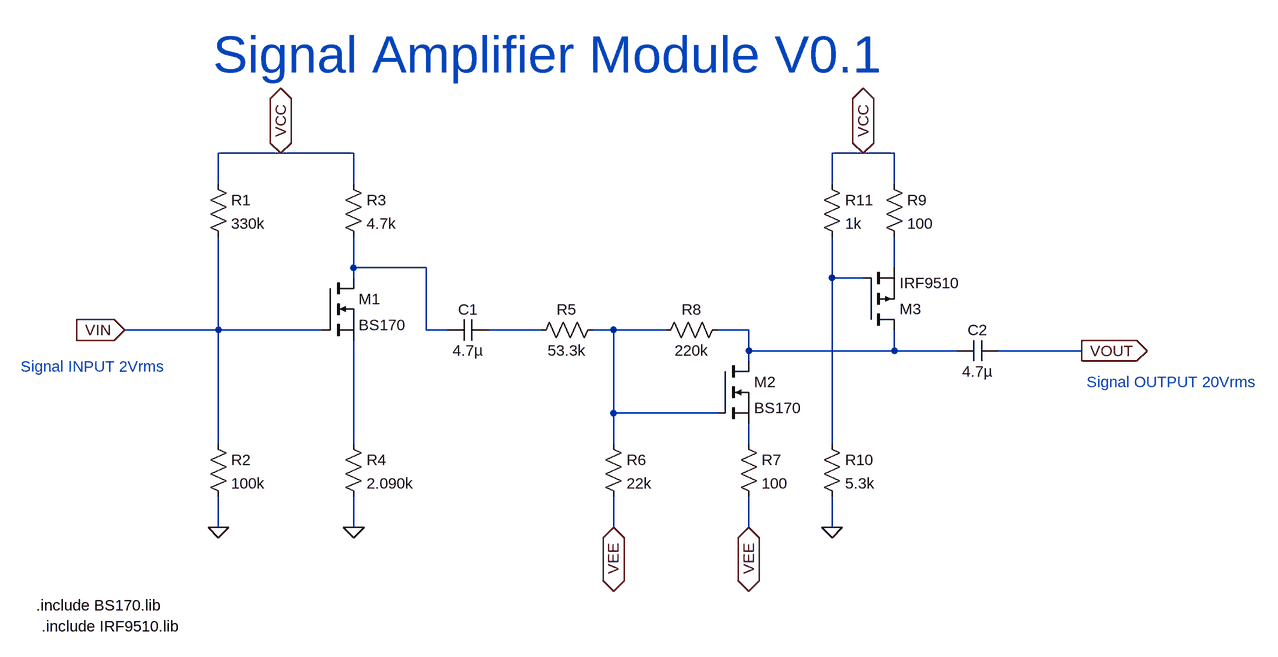
[diagram p0: schematic SigAmpModule_LTspice.asc]
SigAmpModule_LTspice.asc, the LTspice schematic file:
Version 4.1
SHEET 1 1688 680
WIRE 176 -80 80 -80
WIRE 288 -80 176 -80
WIRE 1072 -80 1024 -80
WIRE 1120 -80 1072 -80
WIRE 80 -32 80 -80
WIRE 288 -32 288 -80
WIRE 1024 -32 1024 -80
WIRE 1120 -32 1120 -80
WIRE 288 96 288 48
WIRE 400 96 288 96
WIRE 1120 96 1120 48
WIRE 288 112 288 96
WIRE 1024 112 1024 48
WIRE 1072 112 1024 112
WIRE 80 192 80 48
WIRE 80 192 -64 192
WIRE 240 192 80 192
WIRE 400 192 400 96
WIRE 432 192 400 192
WIRE 576 192 496 192
WIRE 688 192 656 192
WIRE 768 192 688 192
WIRE 896 192 848 192
WIRE 896 224 896 192
WIRE 1120 224 1120 192
WIRE 1120 224 896 224
WIRE 1216 224 1120 224
WIRE 1408 224 1280 224
WIRE 896 240 896 224
WIRE 688 320 688 192
WIRE 848 320 688 320
WIRE 80 368 80 192
WIRE 288 368 288 208
WIRE 688 368 688 320
WIRE 896 368 896 336
WIRE 1024 368 1024 112
WIRE 80 496 80 448
WIRE 288 496 288 448
WIRE 688 496 688 448
WIRE 896 496 896 448
WIRE 1024 496 1024 448
FLAG 176 -80 VCC
IOPIN 176 -80 BiDir
FLAG 80 496 0
FLAG -64 192 VIN
IOPIN -64 192 In
FLAG 288 496 0
FLAG 688 496 VEE
IOPIN 688 496 BiDir
FLAG 896 496 VEE
IOPIN 896 496 BiDir
FLAG 1024 496 0
FLAG 1072 -80 VCC
IOPIN 1072 -80 BiDir
FLAG 1408 224 VOUT
IOPIN 1408 224 Out
SYMBOL res 64 -48 R0
SYMATTR InstName R1
SYMATTR Value 330k
SYMBOL res 64 352 R0
SYMATTR InstName R2
SYMATTR Value 100k
SYMBOL res 272 -48 R0
SYMATTR InstName R3
SYMATTR Value 4.7k
SYMBOL res 272 352 R0
SYMATTR InstName R4
SYMATTR Value 2.090k
SYMBOL nmos 240 112 R0
SYMATTR InstName M1
SYMATTR Value BS170
SYMATTR Prefix X
SYMBOL cap 496 176 R90
WINDOW 0 0 32 VBottom 2
WINDOW 3 32 32 VTop 2
SYMATTR InstName C1
SYMATTR Value 4.7µ
SYMBOL res 672 176 R90
WINDOW 0 0 56 VBottom 2
WINDOW 3 32 56 VTop 2
SYMATTR InstName R5
SYMATTR Value 53.3k
SYMBOL res 880 352 R0
SYMATTR InstName R7
SYMATTR Value 100
SYMBOL res 672 352 R0
SYMATTR InstName R6
SYMATTR Value 22k
SYMBOL res 752 208 R270
WINDOW 0 32 56 VTop 2
WINDOW 3 0 56 VBottom 2
SYMATTR InstName R8
SYMATTR Value 220k
SYMBOL nmos 848 240 R0
SYMATTR InstName M2
SYMATTR Value BS170
SYMATTR Prefix X
SYMBOL pmos 1072 192 M180
SYMATTR InstName M3
SYMATTR Value IRF9510
SYMATTR Prefix X
SYMBOL res 1104 -48 R0
SYMATTR InstName R9
SYMATTR Value 100
SYMBOL res 1008 352 R0
SYMATTR InstName R10
SYMATTR Value 5.3k
SYMBOL res 1008 -48 R0
SYMATTR InstName R11
SYMATTR Value 1k
SYMBOL cap 1280 208 R90
WINDOW 0 0 32 VBottom 2
WINDOW 3 32 32 VTop 2
SYMATTR InstName C2
SYMATTR Value 4.7µ
TEXT 72 -232 Left 6 ;Signal Amplifier Module V0.1
TEXT -224 248 Left 2 ;Signal INPUT 2Vrms
TEXT 1416 272 Left 2 ;Signal OUTPUT 20Vrms
TEXT -200 616 Left 2 !.include BS170.lib
TEXT -192 648 Left 2 !.include IRF9510.lib

The netlist it stands for:
* SigAmpModule_LTspice.asc
R1 VCC VIN 330k
R2 VIN 0 100k
R3 VCC N001 4.7k
R4 N007 0 2.090k
X§M1 N001 VIN N007 BS170  ; pins D G S
C1 N004 N001 4.7µ
R5 N005 N004 53.3k
R7 N008 VEE 100
R6 N005 VEE 22k
R8 N005 N006 220k
X§M2 N006 N005 N008 BS170  ; pins D G S
X§M3 N006 N003 N002 IRF9510  ; pins D G S
R9 VCC N002 100
R10 N003 0 5.3k
R11 VCC N003 1k
C2 VOUT N006 4.7µ
* Signal Amplifier Module V0.1
* Signal INPUT 2Vrms
* Signal OUTPUT 20Vrms
.include BS170.lib
.include IRF9510.lib
.backanno
.end